# Altium schematic sheet vi_dieu_khien.SchDoc
size D; SheetNumber: 3; SheetTotal: 4
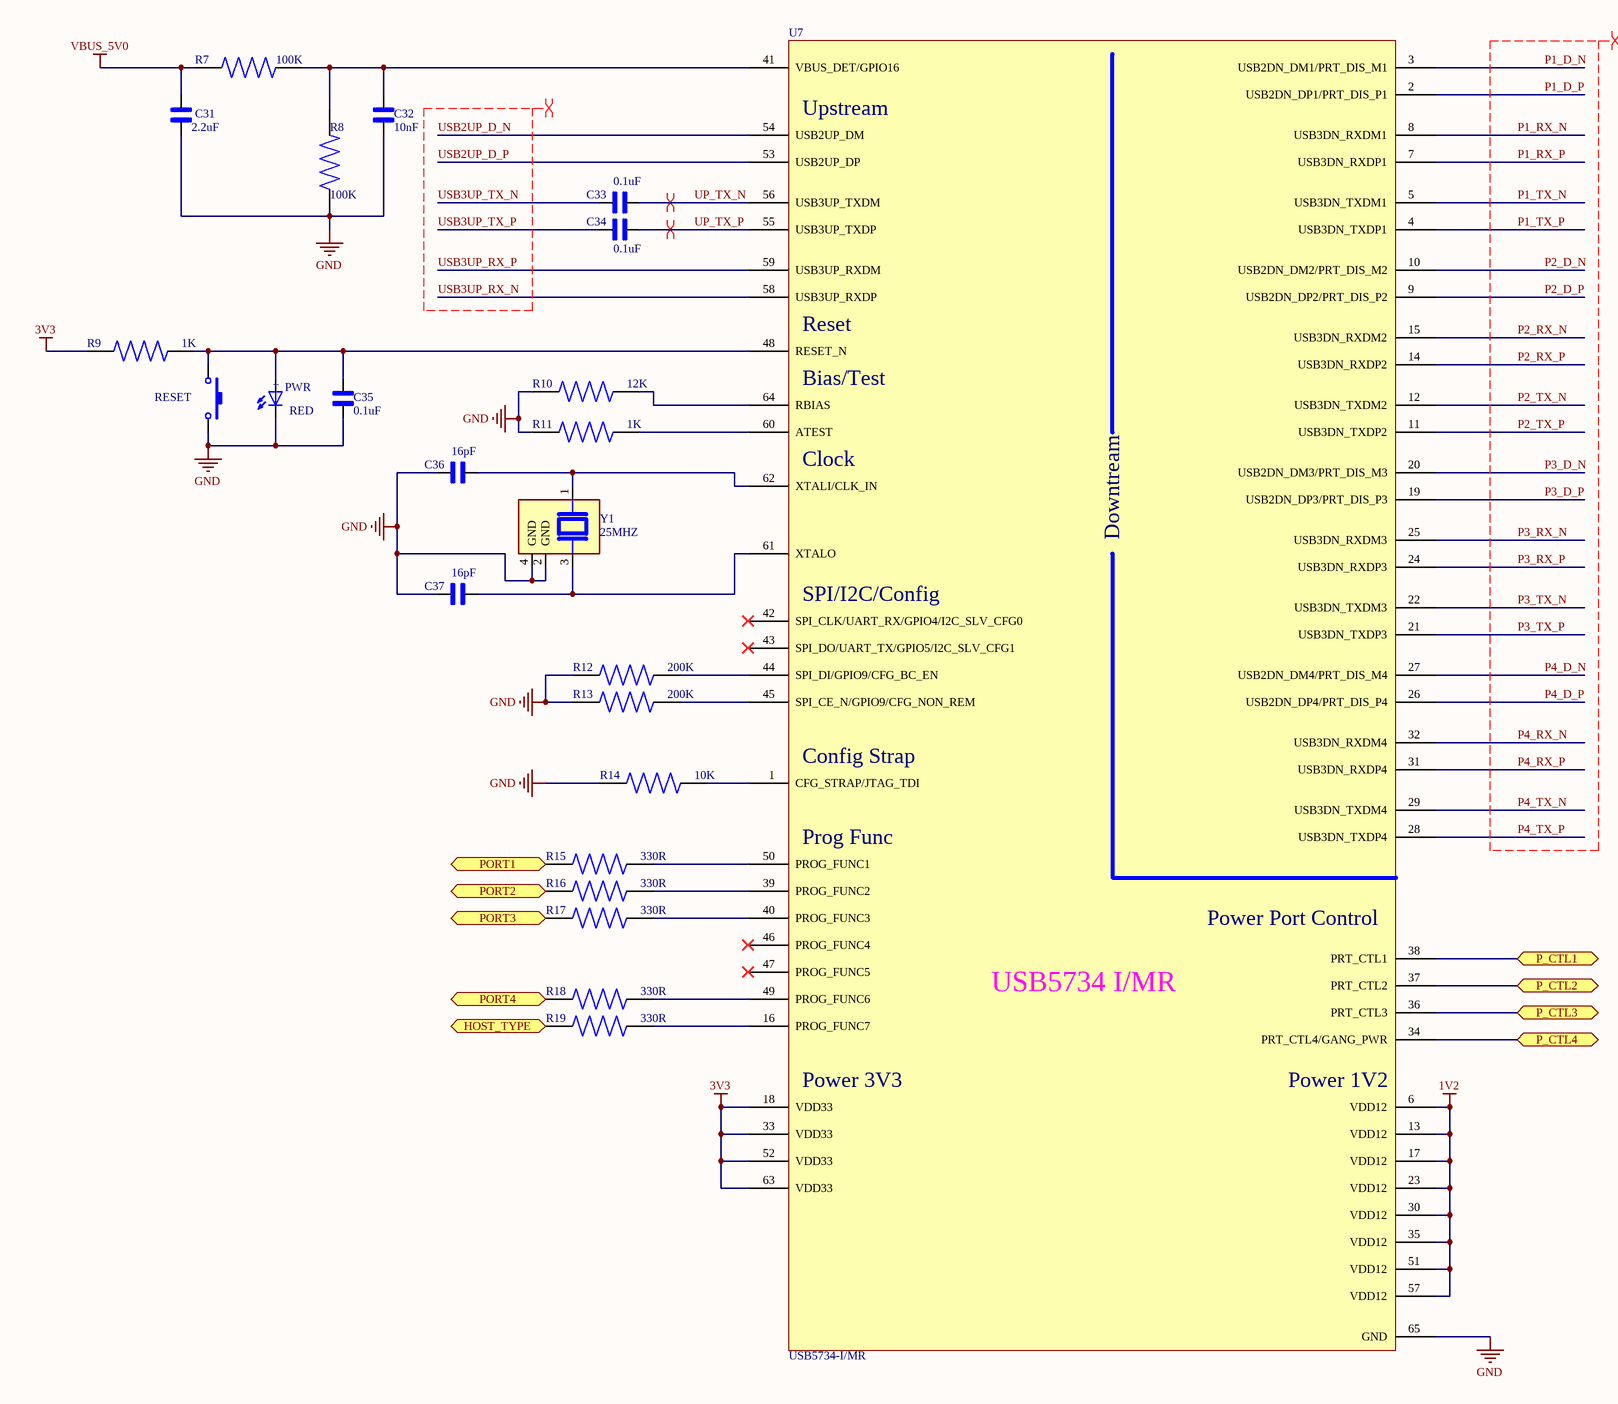
[diagram p0: vi_dieu_khien.SchDoc]

## Parts
C31  2.2uF  [CAPC3216X170N]
C32  10nF  [CAPC1608X94N]
C33  0.1uF  [CAPC1608X94N]
C34  0.1uF  [CAPC1608X94N]
C35  0.1uF  [CAPC1608X94N]
C36  16pF  [CAPC1608X94N]
C37  16pF  [CAPC1608X94N]
PWR  RED  [WL-SMCW_1206]
R7  100K  [RES_ERJU03J474V]
R8  100K  [RES_ERJU03J474V]
R9  1K  [RES_ERJU03J474V]
R10  12K  [RES_ERJU03J474V]
R11  1K  [RES_ERJU03J474V]
R12  200K  [RES_ERJU03J474V]
R13  200K  [RES_ERJU03J474V]
R14  10K  [RES_ERJU03J474V]
R15  330R  [RES_ERJU03J474V]
R16  330R  [RES_ERJU03J474V]
R17  330R  [RES_ERJU03J474V]
R18  330R  [RES_ERJU03J474V]
R19  330R  [RES_ERJU03J474V]
RESET  Nut Nhan 2 Chan SMD 3x6x2.5  [PCBComponent_1]  (value not drawn)
U7  USB5734-I/MR  [USB5734-I/MR]
Y1  25MHZ  [XTAL_ABM8G-25.000MHZ-B4Y-T]

## Ports
HOST_TYPE (bidir), P_CTL1 (bidir), P_CTL2 (bidir), P_CTL3 (bidir), P_CTL4 (bidir), PORT1 (bidir), PORT2 (bidir), PORT3 (bidir), PORT4 (bidir)

## Nets
1V2: U7.6(VDD12) U7.13(VDD12) U7.17(VDD12) U7.23(VDD12) U7.30(VDD12) U7.35(VDD12) U7.51(VDD12) U7.57(VDD12)
3V3: R9.1 U7.18(VDD33) U7.33(VDD33) U7.52(VDD33) U7.63(VDD33)
GND: C31.1 C32.1 C35.1 C36.1 C37.1 PWR.1(NEG) R8.2 R10.1 R11.1 R12.1 R13.1 R14.1 RESET.2 U7.65(GND) Y1.2(GND) Y1.4(GND)
VBUS_5V0: C31.2 R7.1
HOST_TYPE: R19.1 ; port HOST_TYPE
P1_D_N: U7.3(USB2DN_DM1/PRT_DIS_M1)
P1_D_P: U7.2(USB2DN_DP1/PRT_DIS_P1)
P1_RX_N: U7.8(USB3DN_RXDM1)
P1_RX_P: U7.7(USB3DN_RXDP1)
P1_TX_N: U7.5(USB3DN_TXDM1)
P1_TX_P: U7.4(USB3DN_TXDP1)
P2_D_N: U7.10(USB2DN_DM2/PRT_DIS_M2)
P2_D_P: U7.9(USB2DN_DP2/PRT_DIS_P2)
P2_RX_N: U7.15(USB3DN_RXDM2)
P2_RX_P: U7.14(USB3DN_RXDP2)
P2_TX_N: U7.12(USB3DN_TXDM2)
P2_TX_P: U7.11(USB3DN_TXDP2)
P3_D_N: U7.20(USB2DN_DM3/PRT_DIS_M3)
P3_D_P: U7.19(USB2DN_DP3/PRT_DIS_P3)
P3_RX_N: U7.25(USB3DN_RXDM3)
P3_RX_P: U7.24(USB3DN_RXDP3)
P3_TX_N: U7.22(USB3DN_TXDM3)
P3_TX_P: U7.21(USB3DN_TXDP3)
P4_D_N: U7.27(USB2DN_DM4/PRT_DIS_M4)
P4_D_P: U7.26(USB2DN_DP4/PRT_DIS_P4)
P4_RX_N: U7.32(USB3DN_RXDM4)
P4_RX_P: U7.31(USB3DN_RXDP4)
P4_TX_N: U7.29(USB3DN_TXDM4)
P4_TX_P: U7.28(USB3DN_TXDP4)
P_CTL1: U7.38(PRT_CTL1) ; port P_CTL1
P_CTL2: U7.37(PRT_CTL2) ; port P_CTL2
P_CTL3: U7.36(PRT_CTL3) ; port P_CTL3
P_CTL4: U7.34(PRT_CTL4/GANG_PWR) ; port P_CTL4
PORT1: R15.1 ; port PORT1
PORT2: R16.1 ; port PORT2
PORT3: R17.1 ; port PORT3
PORT4: R18.1 ; port PORT4
UP_TX_N: C33.2 U7.56(USB3UP_TXDM)
UP_TX_P: C34.2 U7.55(USB3UP_TXDP)
USB2UP_D_N: U7.54(USB2UP_DM)
USB2UP_D_P: U7.53(USB2UP_DP)
USB3UP_RX_N: U7.58(USB3UP_RXDP)
USB3UP_RX_P: U7.59(USB3UP_RXDM)
USB3UP_TX_N: C33.1
USB3UP_TX_P: C34.1
NetC32_2: C32.2 R7.2 R8.1 U7.41(VBUS_DET/GPIO16)
NetC35_2: C35.2 PWR.2(POS) R9.2 RESET.1 U7.48(RESET_N)
NetC36_2: C36.2 U7.62(XTALI/CLK_IN) Y1.1
NetC37_2: C37.2 U7.61(XTALO) Y1.3
NetR10_2: R10.2 U7.64(RBIAS)
NetR11_2: R11.2 U7.60(ATEST)
NetR12_2: R12.2 U7.44(SPI_DI/GPIO9/CFG_BC_EN)
NetR13_2: R13.2 U7.45(SPI_CE_N/GPIO9/CFG_NON_REM)
NetR14_2: R14.2 U7.1(CFG_STRAP/JTAG_TDI)
NetR15_2: R15.2 U7.50(PROG_FUNC1)
NetR16_2: R16.2 U7.39(PROG_FUNC2)
NetR17_2: R17.2 U7.40(PROG_FUNC3)
NetR18_2: R18.2 U7.49(PROG_FUNC6)
NetR19_2: R19.2 U7.16(PROG_FUNC7)

Not connected (* = marked no-connect by the designer): U7 42(SPI_CLK/UART_RX/GPIO4/I2C_SLV_CFG0)* 43(SPI_DO/UART_TX/GPIO5/I2C_SLV_CFG1)* 46(PROG_FUNC4)* 47(PROG_FUNC5)*

## Layout directives
differential pair: P1_D_N, P1_D_P, P1_RX_N, P1_RX_P, P1_TX_N, P1_TX_P, P2_D_N, P2_D_P, P2_RX_N, P2_RX_P, P2_TX_N, P2_TX_P, P3_D_N, P3_D_P, P3_RX_N, P3_RX_P, P3_TX_N, P3_TX_P, P4_D_N, P4_D_P, P4_RX_N, P4_RX_P, P4_TX_N, P4_TX_P, UP_TX_N, UP_TX_P, USB2UP_D_N, USB2UP_D_P, USB3UP_RX_N, USB3UP_RX_P, USB3UP_TX_N, USB3UP_TX_P

## Notes on the sheet
- (in symbol USB5734-I/MR) Upstream; Reset; Bias/Test; Clock; Downtream; SPI/I2C/Config; Config Strap; Prog Func; Power Port Control; USB5734 I/MR; Power 3V3; Power 1V2
- (in symbol WL-SMCW_1206) +

## Library data of the parts
C31 = cap_1206_VJ1206A330JXCAP: cap 1206 (3216 Metric); MF: Vishay Vitramon; SnapEDA_Link: https://www.snapeda.com/parts/VJ1206A330JXCAP/Vishay/view-part/?ref=snap; Package: 3216 Vishay Vitramon; Value: *; MP: VJ1206A330JXCAP; Check_prices: https://www.snapeda.com/parts/VJ1206A330JXCAP/Vishay/view-part/?ref=eda
C32-C37 = cap_0603_VJ0603D3R9DXCAP: cap 0603 (1608 Metric); MF: Vishay Vitramon; SnapEDA_Link: https://www.snapeda.com/parts/VJ0603D3R9DXCAP/Vishay/view-part/?ref=snap; Package: 1608 Vishay Vitramon; Value: *; MP: VJ0603D3R9DXCAP; Check_prices: https://www.snapeda.com/parts/VJ0603D3R9DXCAP/Vishay/view-part/?ref=eda
PWR = WL-SMCW_1206: 1206, RED Typ.(@20mA): 470nm, 145mcd, 3.2V, 140Â° InGaN; MF: Wurth Electronics; MP: 150120BS75000; SnapEDA_Link: https://www.snapeda.com/parts/150120BS75000/Wurth+Electronics/view-part/?ref=snap; Package: 1206 Wurth Electronics; Value: *; Check_prices: https://www.snapeda.com/parts/150120BS75000/Wurth+Electronics/view-part/?ref=eda
R7-R19 = res_0603_ERJU03J474V: 0603 Anti-Sulfurated; MF: Panasonic; SnapEDA_Link: https://www.snapeda.com/parts/ERJU03J474V/Panasonic/view-part/?ref=snap; Package: 1608-2 Panasonic; Value: *; MP: ERJU03J474V; Check_prices: https://www.snapeda.com/parts/ERJU03J474V/Panasonic/view-part/?ref=eda
RESET = Nut Nhan 2 Chan SMD 3x6x2.5: Ma_Hang: MH001036; Ten: Nút Nhấn 2 Chân 3x6x2.5MM SMD
U7 = USB5734-I/MR: USB5734-I/MR / USB Hub Controller USB 3.0 I2C, SPI, UART Interface 64-VQFN (9x9)
Y1 = Thach_anh_3.2x2.5_ABM8G-25.000MHZ-B4Y-T: 25 MHz Â±30ppm Crystal 10pF 60 Ohms 4-SMD, No Lead / ABM8G-25.000MHZ-B4Y-T; MF: Abracon; Value: *; SnapEDA_Link: https://www.snapeda.com/parts/ABM8G-25.000MHZ-B4Y-T/Abracon+LLC/view-part/?ref=snap; MP: ABM8G-25.000MHZ-B4Y-T; Check_prices: https://www.snapeda.com/parts/ABM8G-25.000MHZ-B4Y-T/Abracon+LLC/view-part/?ref=eda; Availability: In Stock; Price: None; Purchase-URL: https://pricing.snapeda.com/search/part/ABM8G-25.000MHZ-B4Y-T/?ref=eda; Package: SMD-4 Abracon